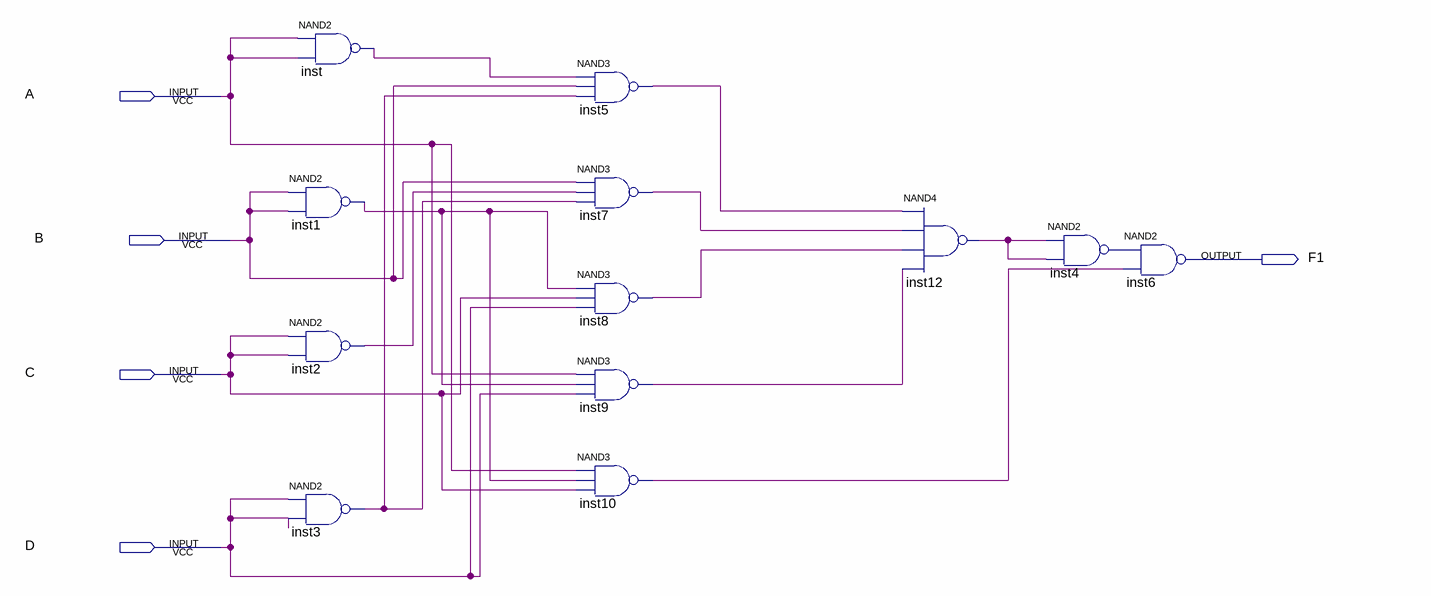
[diagram p0: schematic sheet]
// Quartus schematic lab2part2.bdf as structural Verilog: 12 symbols, 5 pins
module lab2part2 (
  input  A,
  input  B,
  input  C,
  input  D,
  output F1
);

  wire inst1_out, inst2_out, inst3_out, inst4_out, inst5_out, inst7_out, inst8_out, inst9_out, inst10_out,
       inst12_out, inst_out;

  nand inst (inst_out, A, A);
  nand inst1 (inst1_out, B, B);
  nand inst2 (inst2_out, C, C);
  nand inst3 (inst3_out, D, D);
  nand inst5 (inst5_out, inst_out, B, inst3_out);
  nand inst7 (inst7_out, B, inst2_out, inst3_out);
  nand inst8 (inst8_out, inst1_out, C, D);
  nand inst9 (inst9_out, A, inst1_out, D);
  nand inst10 (inst10_out, A, inst1_out, C);
  nand inst12 (inst12_out, inst5_out, inst7_out, inst8_out, inst9_out);
  nand inst4 (inst4_out, inst12_out, inst12_out);
  nand inst6 (F1, inst4_out, inst10_out);
endmodule
